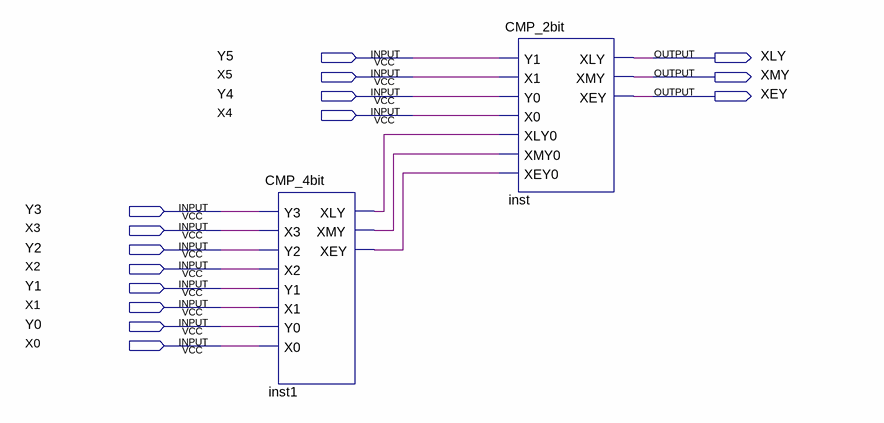
[diagram p0: schematic sheet]
// Quartus schematic CMP_6BIT.bdf as structural Verilog: 2 symbols, 15 pins
module CMP_6BIT (
  input  Y5,
  input  X5,
  input  Y4,
  input  X4,
  input  Y3,
  input  X3,
  input  Y2,
  input  X2,
  input  Y1,
  input  X1,
  input  Y0,
  input  X0,
  output XLY,
  output XMY,
  output XEY
);

  wire inst1_xey, inst1_xly, inst1_xmy;

  CMP_4bit inst1 (
    .Y3(Y3), .X3(X3), .Y2(Y2), .X2(X2), .Y1(Y1), .X1(X1), .Y0(Y0), .X0(X0), .XLY(inst1_xly), .XMY(inst1_xmy),
    .XEY(inst1_xey));
  CMP_2bit inst (
    .Y1(Y5), .X1(X5), .Y0(Y4), .X0(X4), .XLY0(inst1_xly), .XMY0(inst1_xmy), .XEY0(inst1_xey), .XLY(XLY),
    .XMY(XMY), .XEY(XEY));
endmodule
